# Altium schematic sheet CODEC_INTERFACE.SchDoc
size A4; SheetNumber: 20; SheetTotal: 20
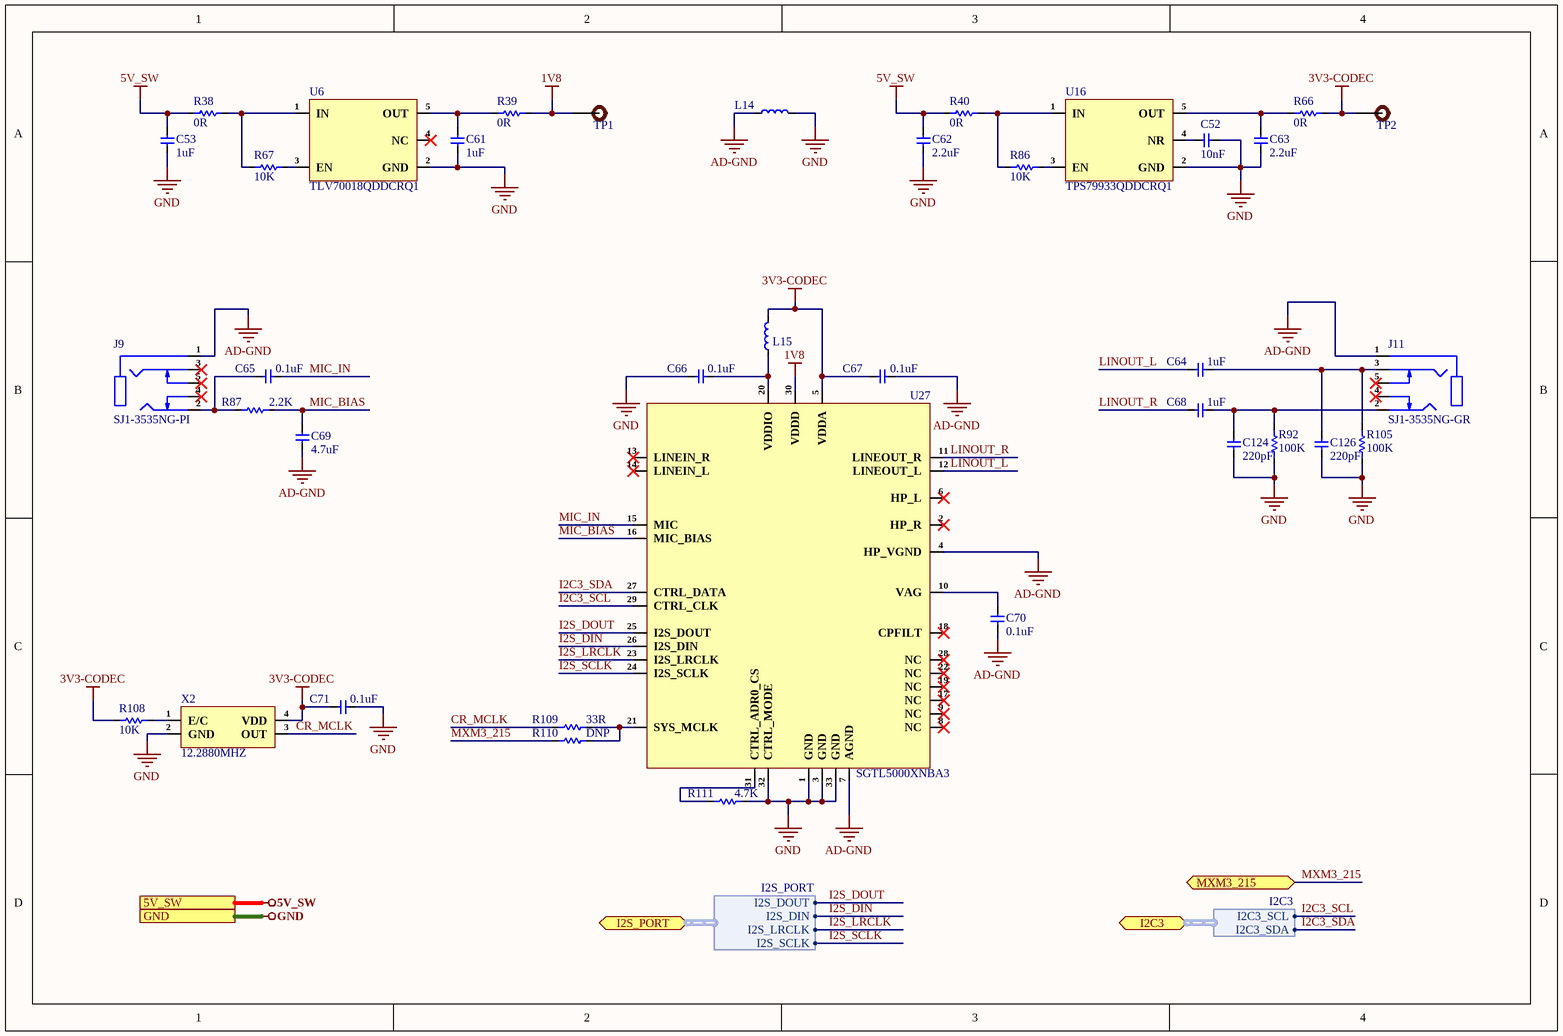
[diagram p0: CODEC_INTERFACE.SchDoc]

## Parts
C52  10nF  [Cap-0402]
C53  1uF  [Cap-0603]
C61  1uF  [Cap-0603]
C62  2.2uF  [Cap-0603]
C63  2.2uF  [Cap-0603]
C64  1uF  [Cap-0603]
C65  0.1uF  [Cap-0402]
C66  0.1uF  [Cap-0402]
C67  0.1uF  [Cap-0402]
C68  1uF  [Cap-0603]
C69  4.7uF  [Cap-0603]
C70  0.1uF  [Cap-0402]
C71  0.1uF  [Cap-0402]
C124  220pF  [Cap-0402]
C126  220pF  [Cap-0402]
J9  SJ1-3535NG-PI  [SJ1-3535NG-PI]
J11  SJ1-3535NG-GR  [SJ1-3535NG-GR]
L14  BLM21PG220SN1D  [Ind-0805]  (value not drawn)
L15  BLM21PG220SN1D  [Ind-0805]  (value not drawn)
R38  0R  [Res-1206]
R39  0R  [Res-1206]
R40  0R  [Res-1206]
R66  0R  [Res-1206]
R67  10K  [Res-0603]
R86  10K  [Res-0603]
R87  2.2K  [Res-0603]
R92  100K  [Res-0402]
R105  100K  [Res-0402]
R108  10K  [Res-0603]
R109  33R  [Res-0402]
R110  DNP  [Res-0402]
R111  4.7K  [Res-0603]
TP1  DNP  [Test-point]  (value not drawn)
TP2  DNP  [Test-point]  (value not drawn)
U6  TLV70018QDDCRQ1  [SOT-23-5]
U16  TPS79933QDDCRQ1  [SOT-23-5]
U27  SGTL5000XNBA3  [32-QFN]
X2  12.2880MHZ  [AU-12.288MBE-T]

## Ports
5V_SW (see Top_Sheet[4B], APALIS_POWER_SUPPLY[1D], FUTURE_USE_CONNECTOR[1D], HDMI_INTERFACE[1D], LTE_MODULE[1D], USB3.0_INTERFACE[1D]), GND (see Top_Sheet[3B], 03-CAN2_SPI_CAN_CONTROLLER[1D], APALIS_POWER_SUPPLY[1D], CAN2_SPI_CAN_CONTROLLER[1D], CONNECTORS[1D], DC_DC_CONVERTER[1D], DIGITAL_I-O_O-P[1D], ETHERNET_INTERFACE[1D], FUTURE_USE_CONNECTOR[1D], GPIO_NC_INTERFACE[4B], HDMI_INTERFACE[1D], I2C_INTERFACE[1B], INPUT_SUPPLY_PROTECTION[1D], LTE_MODULE[1D], MECHANICAL_FOR_PCB[1D], MICRO_SD_CARD_INTERFACE[1D], Reset_and_SDIO[1D], UART_INTERFACE[1D], USB3.0_INTERFACE[1D]), I2C3 (bidir, harness I2C3, see Top_Sheet[4B], CONNECTORS[2C], I2C_INTERFACE[4B]), I2S_PORT (bidir, harness I2S_PORT, see Top_Sheet[3C], GPIO_NC_INTERFACE[1A]), MXM3_215 (bidir, see Top_Sheet[3B], GPIO_NC_INTERFACE[2A])

## Harnesses
I2C3: I2C3_SCL, I2C3_SDA
I2S_PORT: I2S_DOUT, I2S_DIN, I2S_LRCLK, I2S_SCLK

## Nets
1V8: R39.2 TP1.1 U27.30(VDDD)
3V3-CODEC: C67.1 C71.2 L15.2 R66.2 R108.1 TP2.1 U27.5(VDDA) X2.4(VDD)
5V_SW: C53.2 C62.2 R38.1 R40.1 ; port 5V_SW
AD-GND: C67.2 C69.1 C70.2 J9.1 J11.1 L14.1 U27.4(HP_VGND) U27.7(AGND)
GND: C52.2 C53.1 C61.1 C62.1 C63.1 C66.2 C71.1 C124.1 C126.1 L14.2 R92.1 R105.1 R111.2 U6.2(GND) U16.2(GND) U27.1(GND) U27.3(GND) U27.32(CTRL_MODE) U27.33(GND) X2.2(GND) ; port GND
CR_MCLK: R109.1 X2.3(OUT)
I2C3_SCL: U27.29(CTRL_CLK) ; port I2C3.I2C3_SCL
I2C3_SDA: U27.27(CTRL_DATA) ; port I2C3.I2C3_SDA
I2S_DIN: U27.26(I2S_DIN) ; port I2S_PORT.I2S_DIN
I2S_DOUT: U27.25(I2S_DOUT) ; port I2S_PORT.I2S_DOUT
I2S_LRCLK: U27.23(I2S_LRCLK) ; port I2S_PORT.I2S_LRCLK
I2S_SCLK: U27.24(I2S_SCLK) ; port I2S_PORT.I2S_SCLK
LINOUT_L: C64.2 U27.12(LINEOUT_L)
LINOUT_R: C68.2 U27.11(LINEOUT_R)
MIC_BIAS: C69.2 R87.2 U27.16(MIC_BIAS)
MIC_IN: C65.2 U27.15(MIC)
MXM3_215: R110.1 ; port MXM3_215
NetC52_1: C52.1 U16.4(NR)
NetC61_2: C61.2 R39.1 U6.5(OUT)
NetC63_2: C63.2 R66.1 U16.5(OUT)
NetC64_1: C64.1 C126.2 J11.3 R105.2
NetC65_1: C65.1 J9.2 R87.1
NetC66_1: C66.1 L15.1 U27.20(VDDIO)
NetC68_1: C68.1 C124.2 J11.2 R92.2
NetC70_1: C70.1 U27.10(VAG)
NetR38_2: R38.2 R67.1 U6.1(IN)
NetR40_2: R40.2 R86.1 U16.1(IN)
NetR67_2: R67.2 U6.3(EN)
NetR86_2: R86.2 U16.3(EN)
NetR108_2: R108.2 X2.1(E/C)
NetR109_2: R109.2 R110.2 U27.21(SYS_MCLK)
NetR111_1: R111.1 U27.31(CTRL_ADR0_CS)

Not connected (* = marked no-connect by the designer): J9 3* 4* 5*; J11 4* 5*; U6 4(NC)*; U27 2(HP_R)* 6(HP_L)* 8(NC)* 9(NC)* 13(LINEIN_R)* 14(LINEIN_L)* 17(NC)* 18(CPFILT)* 19(NC)* 22(NC)* 28(NC)*

## Library data of the parts
C52 = C0402C103K5RAC7411: CAP CER 10000PF 50V X7R 0402; Manufacturer: KEMET; Dielectric Material: Ceramic; Tolerance: 10%; Item Type: Capacitor; Supplier: Mouser; Supplier Part Number: 80-C0402C103K5R7411; Manufacturer Part Number: C0402C103K5RAC7411; RoHS: Yes; Category: Ceramic Capacitors; Stock: 440672; Pricing: 1=0.1, 10=0.017, 50=0.017, 100=0.009, 1000=0.005, 10000=0.004 (USD); Mounting Technology: Surface Mount; Case/Package: 0402; Min Operating Temperature: -55°C; Max Operating Temperature: 125°C; Value: 10nF; Dielectric: X7R; Voltage Rating (DC): 50V; Construction: Flat; Length: 1mm; Height: 0.5mm; Depth: 0.5mm; Radiation Hardening: No; RoHS Compliant: Yes; ComponentLink1URL: http://capacitoredge.kemet.com/capedge2/DataSheet?pn=C0402C103K5RAC7411&src-supplier=Avnet; ComponentLink1Description: http://capacitoredge.kemet.com/capedge2/DataSheet?pn=C0402C103K5RAC7411&src-supplier=Avnet
C53 C61 C64 C68 = CGA3E1X7R1E105K080AC: CAP CER 1UF 25V X7R 0603; Manufacturer: TDK; Material: 4241ConductorMaterial; Tolerance: 10%; Supplier: Rs; Supplier Part Number: 7882925P; Manufacturer Part Number: CGA3E1X7R1E105K080AC; RoHS: Yes; Category: Ceramic Capacitors; Stock: 80700; Pricing: 800=0.027, 2000=0.026 (GBP); Mounting Technology: Surface Mount; Case/Package: 0603; Case Code (Metric): 1608; Case Code (Imperial): 0603; Weight: 7.1E-05oz; Min Operating Temperature: -55°C; Max Operating Temperature: 125°C; Value: 1uF; Packaging: Tape and Reel; Dielectric: X7R; Voltage Rating: 25V; Package Quantity: 1; Voltage Rating (DC): 25V; Termination: SMD/SMT; Voltage: 25V; Series: CGA; Length: 1.6mm; Width: 0.031inch; Height: 0.8mm; Depth: 0.8mm; Thickness: 0.035inch; Ratings: AEC-Q200; Lead Free: Lead Free; Reach SVHC Compliant: No; RoHS Compliant: Yes; ComponentLink1URL: https://datasheet.ciiva.com/24216/cga3e1x7r1e105k080ac-265757-24216362.pdf?src-supplier=Mouser; ComponentLink1Description: https://datasheet.ciiva.com/24216/cga3e1x7r1e105k080ac-265757-24216362.pdf?src-supplier=Mouser; ComponentLink2URL: https://datasheet.ciiva.com/23803/1936565-23803078.pdf?src-supplier=Newark; ComponentLink2Description: https://datasheet.ciiva.com/23803/1936565-23803078.pdf?src-supplier=Newark; ComponentLink3URL: https://datasheet.ciiva.com/46385/1735392-46385705.pdf?src-supplier=Element14; ComponentLink3Description: https://datasheet.ciiva.com/46385/1735392-46385705.pdf?src-supplier=Element14; ComponentLink4URL: https://datasheet.ciiva.com/48573/2288cga3e1x7r1e105k080ac-48573708.pdf?src-supplier=Onlinecomponents.com; ComponentLink4Description: https://datasheet.ciiva.com/48573/2288cga3e1x7r1e105k080ac-48573708.pdf?src-supplier=Onlinecomponents.com; ComponentLink5URL: https://datasheet.ciiva.com/16428/mlccspec-automotive-general-midvoltage-en-16428542.pdf?src-supplier=Future+Electronics; ComponentLink5Description: https://datasheet.ciiva.com/16428/mlccspec-automotive-general-midvoltage-en-16428542.pdf?src-supplier=Future+Electronics
C62 C63 = C1608X7R1A225K080AC: CAP CER 2.2UF 10V X7R 0603; Manufacturer: TDK; Dielectric Material: Ceramic; Tolerance: 10%; Item type: Capacitor; Supplier: Rs; Supplier Part Number: 9040237; Manufacturer Part Number: C1608X7R1A225K080AC; RoHS: Yes; Category: Ceramic Capacitors; Stock: 4700; Pricing: 50=0.061, 250=0.052, 500=0.043, 1000=0.04, 2000=0.036 (GBP); Mounting Technology: Surface Mount; Case/Package: 0603; Case Code (Metric): 1608; Case Code (Imperial): 0603; Weight: 7.1E-05oz; Min Operating Temperature: -55°C; Max Operating Temperature: 125°C; Packaging: Tape and Reel; Value: 2.2uF; Dielectric: X7R; Construction: Flat; Voltage Rating: 10V; Voltage Rating (DC): 10V; Series: C; Package Quantity: 4000; Termination: SMD/SMT; Length: 1.6mm; Width: 0.8mm; Height: 0.8mm; Depth: 0.8mm; Lead Free: Lead Free; Reach SVHC Compliant: No; RoHS Compliant: Yes; ComponentLink1URL: https://datasheet.ciiva.com/24216/c1608x7r1a225k080ac-264808-24216485.pdf?src-supplier=Mouser; ComponentLink1Description: https://datasheet.ciiva.com/24216/c1608x7r1a225k080ac-264808-24216485.pdf?src-supplier=Mouser; ComponentLink2URL: https://datasheet.ciiva.com/22718/1796654-22718012.pdf?src-supplier=Element14; ComponentLink2Description: https://datasheet.ciiva.com/22718/1796654-22718012.pdf?src-supplier=Element14; ComponentLink3URL: https://datasheet.ciiva.com/6290/tdkmlcccaprange-6290821.pdf?src-supplier=Digi-Key; ComponentLink3Description: https://datasheet.ciiva.com/6290/tdkmlcccaprange-6290821.pdf?src-supplier=Digi-Key; ComponentLink4URL: https://datasheet.ciiva.com/6290/tdkmlcccaprange-6290824.pdf?src-supplier=Digi-Key; ComponentLink4Description: https://datasheet.ciiva.com/6290/tdkmlcccaprange-6290824.pdf?src-supplier=Digi-Key; ComponentLink5URL: https://datasheet.ciiva.com/23802/1796654-23802775.pdf?src-supplier=Newark; ComponentLink5Description: https://datasheet.ciiva.com/23802/1796654-23802775.pdf?src-supplier=Newark; ComponentLink6URL: https://datasheet.ciiva.com/28451/1796654-28451240.pdf?src-supplier=Element14; ComponentLink6Description: https://datasheet.ciiva.com/28451/1796654-28451240.pdf?src-supplier=Element14; ComponentLink7URL: https://datasheet.ciiva.com/22725/1913358-22725529.pdf?src-supplier=Element14; ComponentLink7Description: https://datasheet.ciiva.com/22725/1913358-22725529.pdf?src-supplier=Element14
C65-C67 C70 C71 = C0402C104K4REC7867: Cap Cer 0402 0.1UF 16V X7R 10%; Manufacturer: KEMET; Item Type: Capacitor; Supplier: Digi-Key; Supplier Part Number: 399-C0402C104K4REC7867CT-ND; Manufacturer Part Number: C0402C104K4REC7867; RoHS: No; Category: Ceramic Capacitors; Stock: 10918; Pricing: 1=0.1, 10=0.072, 50=0.0408, 100=0.0338, 500=0.02372, 1000=0.01963, 2500=0.01827, 5000=0.01672 (USD)
C69 = C1608X5R1A475K080AE: CAP CER 4.7UF 10V X5R 0603; Manufacturer: TDK; Item Type: Capacitor; Supplier: Arrow Electronics; Supplier Part Number: C1608X5R1A475K080AE; Manufacturer Part Number: C1608X5R1A475K080AE; RoHS: Yes; Category: Ceramic Capacitors; Stock: 1894; Pricing: 1=0.1954, 10=0.1074, 25=0.1063, 50=0.1053, 100=0.0737, 250=0.073, 500=0.0723, 1000=0.0631 (USD); ComponentLink1URL: https://product.tdk.com/info/en/catalog/datasheets/mlcc_commercial_soft_en.pdf?src-supplier=Digi-Key; ComponentLink1Description: https://product.tdk.com/info/en/catalog/datasheets/mlcc_commercial_soft_en.pdf?src-supplier=Digi-Key; ComponentLink2URL: https://product.tdk.com/info/en/catalog/datasheets/mlcc_commercial_soft_en.pdf?ref_disty=digikey&src-supplier=Digi-Key; ComponentLink2Description: https://product.tdk.com/info/en/catalog/datasheets/mlcc_commercial_soft_en.pdf?ref_disty=digikey&src-supplier=Digi-Key; ComponentLink3URL: https://product.tdk.com/info/en/catalog/spec/mlccspec_commercial_soft_en.pdf?src-supplier=Digi-Key; ComponentLink3Description: https://product.tdk.com/info/en/catalog/spec/mlccspec_commercial_soft_en.pdf?src-supplier=Digi-Key; ComponentLink4URL: https://datasheet.octopart.com/C1608X5R1A475K080AE-TDK-datasheet-60278151.pdf?src-supplier=Future+Electronics; ComponentLink4Description: https://datasheet.octopart.com/C1608X5R1A475K080AE-TDK-datasheet-60278151.pdf?src-supplier=Future+Electronics; ComponentLink5URL: https://datasheet.octopart.com/C1608X5R1A475K080AE-TDK-datasheet-159617022.pdf?src-supplier=TME; ComponentLink5Description: https://datasheet.octopart.com/C1608X5R1A475K080AE-TDK-datasheet-159617022.pdf?src-supplier=TME
C124 C126 = C0402C221K3RACAUTO: Cap Cer 220PF 25V X7R 0402; Manufacturer: KEMET; Supplier: Mouser; Supplier Part Number: 80-C0402C221K3RAUTO; Manufacturer Part Number: C0402C221K3RACAUTO; RoHS: Yes; Category: Ceramic Capacitors; Stock: 7535; Pricing: 1=0.36, 10=0.251, 50=0.251, 100=0.15, 1000=0.095, 10000=0.077 (USD); RoHS Compliant: Yes
J9 = SJ1-3535NG-PI: CONN JACK STEREO 3.5MM R/A Pink; Manufacturer: CUI; Gender: Female; Shielding: Unshielded; Current Rating: 1A; Number of Conductors: 3; Number of Ports: 1; Supplier: Mouser; Supplier Part Number: 490-SJ1-3535NG-PI; Manufacturer Part Number: SJ1-3535NG-PI; RoHS: No; Category: Uncategorized; Mounting Technology: Through Hole; Contact Plating: Tin; Color: Pink; Body Color: Pink; Packaging: Bulk; Termination: Solder; Orientation: Horizontal; Connector Type: Jack; Series: SJ1; Lead Free: Lead Free; RoHS Compliant: No; ComponentLink1URL: https://www.cui.com/product/resource/digikeypdf/sj1-353xng.pdf?src-supplier=Digi-Key; ComponentLink1Description: https://www.cui.com/product/resource/digikeypdf/sj1-353xng.pdf?src-supplier=Digi-Key
J11 = SJ1-3535NG-GR: CONN JACK STEREO 3.5MM R/A Green; Manufacturer: CUI; Gender: Female; Shielding: Unshielded; Current Rating: 1A; Number of Conductors: 3; Number of Ports: 1; Supplier: Mouser; Supplier Part Number: 490-SJ1-3535NG-GR; Manufacturer Part Number: SJ1-3535NG-GR; RoHS: No; Category: Uncategorized; Mounting Technology: Through Hole; Contact Plating: Tin; Color: Green; Body Color: Green; Packaging: Bulk; Termination: Solder; Orientation: Horizontal; Connector Type: Jack; Series: SJ1; Lead Free: Lead Free; RoHS Compliant: No; ComponentLink1URL: https://www.cui.com/product/resource/digikeypdf/sj1-353xng.pdf?src-supplier=Digi-Key; ComponentLink1Description: https://www.cui.com/product/resource/digikeypdf/sj1-353xng.pdf?src-supplier=Digi-Key
L14 L15 = BLM21PG220SN1D: FERRITE BEAD 22 OHM 0805 1LN; Manufacturer: Murata; Supplier: Rs; Supplier Part Number: 7241539P; Manufacturer Part Number: BLM21PG220SN1D; RoHS: Yes; Category: Ferrite Beads and Chips; Stock: 10325; Pricing: 500=0.043, 1000=0.038, 2500=0.033, 5000=0.03 (GBP); ComponentLink1URL: https://datasheet.ciiva.com/14122/anblm21p-data-e-14122211.pdf?src-supplier=Distrelec; ComponentLink1Description: https://datasheet.ciiva.com/14122/anblm21p-data-e-14122211.pdf?src-supplier=Distrelec; ComponentLink2URL: https://datasheet.ciiva.com/11799/0900766b81275e31-11799177.pdf?src-supplier=Rs; ComponentLink2Description: https://datasheet.ciiva.com/11799/0900766b81275e31-11799177.pdf?src-supplier=Rs; ComponentLink3URL: https://datasheet.ciiva.com/29700/1845312-29700540.pdf?src-supplier=Jameco; ComponentLink3Description: https://datasheet.ciiva.com/29700/1845312-29700540.pdf?src-supplier=Jameco; ComponentLink4URL: https://datasheet.ciiva.com/16291/l0110s0100blm21p-16291622.pdf?src-supplier=Future+Electronics; ComponentLink4Description: https://datasheet.ciiva.com/16291/l0110s0100blm21p-16291622.pdf?src-supplier=Future+Electronics; ComponentLink5URL: https://datasheet.ciiva.com/8021/5160-8021589.pdf?src-supplier=Element14; ComponentLink5Description: https://datasheet.ciiva.com/8021/5160-8021589.pdf?src-supplier=Element14; ComponentLink6URL: https://datasheet.ciiva.com/8021/5160-8021591.pdf?src-supplier=Element14; ComponentLink6Description: https://datasheet.ciiva.com/8021/5160-8021591.pdf?src-supplier=Element14; ComponentLink7URL: https://datasheet.ciiva.com/6211/l0110s0100blm21p-6211741.pdf?src-supplier=Digi-Key; ComponentLink7Description: https://datasheet.ciiva.com/6211/l0110s0100blm21p-6211741.pdf?src-supplier=Digi-Key; ComponentLink8URL: https://datasheet.ciiva.com/3081/l0110s0100blm21p-3081653.pdf?src-supplier=Avnet; ComponentLink8Description: https://datasheet.ciiva.com/3081/l0110s0100blm21p-3081653.pdf?src-supplier=Avnet; ComponentLink9URL: https://datasheet.ciiva.com/41449/001171738-da-01-en-chip-drossel0805-22r0-6000ma-2-0x1-25mm-41449366.pdf?src-supplier=Conrad; ComponentLink9Description: https://datasheet.ciiva.com/41449/001171738-da-01-en-chip-drossel0805-22r0-6000ma-2-0x1-25mm-41449366.pdf?src-supplier=Conrad; LCSC Part Number: C88993; Item Type: Ferrite Bead
R38-R40 R66 = RC1206JR-070RL: RES 0 OHM JUMPER 1/4W 1206; Manufacturer: Yageo; Value: 0mR; Tolerance: 5%; Power Rating: 250mW; Voltage Rating: 200V; Temperature Coefficient: 200ppm/°C; Supplier: Future Electronics; Supplier Part Number: 1070203; Manufacturer Part Number: RC1206JR-070RL; RoHS: Yes; Category: Chip SMD Resistors; Stock: 615000; Pricing: 5000=0.0047, 25000=0.0045, 100000=0.0042, 250000=0.0041, 625000=0.0038 (USD); Case/Package: 1206; Contact Plating: Tin,Matte; Case Code (Metric): 3216; Case Code (Imperial): 1206; Min Operating Temperature: -55°C; Max Operating Temperature: 155°C; Resistor Type: Thick Film,Carbon Film; Packaging: Tape and Reel; Package Quantity: 1; Number of Terminations: 2; Termination: SMD/SMT; Max Power Dissipation: 250mW; Series: RC; Resistance Tolerance: 5%; Technology: THICK FILM; Features: Moisture Resistant; Voltage Rating (AC): 200V; Length: 0.122inch; Width: 0.063inch; Height: 0.026inch; Depth: 1.6mm; Lead Free: Lead Free; RoHS Compliant: Yes; Reach SVHC Compliant: Unknown; ComponentLink1URL: https://datasheet.ciiva.com/11808/0900766b80c6630a-11808156.pdf?src-supplier=Rs; ComponentLink1Description: https://datasheet.ciiva.com/11808/0900766b80c6630a-11808156.pdf?src-supplier=Rs; ComponentLink2URL: https://datasheet.ciiva.com/29181/402222-da-01-en-smd-widerstand-0-ohm-1206-29181568.pdf?src-supplier=Conrad; ComponentLink2Description: https://datasheet.ciiva.com/29181/402222-da-01-en-smd-widerstand-0-ohm-1206-29181568.pdf?src-supplier=Conrad; ComponentLink3URL: https://datasheet.ciiva.com/7983/444357-7983807.pdf?src-supplier=Element14; ComponentLink3Description: https://datasheet.ciiva.com/7983/444357-7983807.pdf?src-supplier=Element14; ComponentLink4URL: https://datasheet.ciiva.com/22747/1692832-22747541.pdf?src-supplier=Element14; ComponentLink4Description: https://datasheet.ciiva.com/22747/1692832-22747541.pdf?src-supplier=Element14; ComponentLink5URL: https://datasheet.ciiva.com/46445/444357-46445719.pdf?src-supplier=Element14; ComponentLink5Description: https://datasheet.ciiva.com/46445/444357-46445719.pdf?src-supplier=Element14; ComponentLink6URL: https://datasheet.ciiva.com/2458/pyu-rc1206-51-rohs-l-4-2458669.pdf?src-supplier=Digi-Key; ComponentLink6Description: https://datasheet.ciiva.com/2458/pyu-rc1206-51-rohs-l-4-2458669.pdf?src-supplier=Digi-Key; ComponentLink7URL: https://datasheet.ciiva.com/2458/pyu-rc1206-51-rohs-l-4-2458670.pdf?src-supplier=Digi-Key; ComponentLink7Description: https://datasheet.ciiva.com/2458/pyu-rc1206-51-rohs-l-4-2458670.pdf?src-supplier=Digi-Key; ComponentLink8URL: https://datasheet.ciiva.com/2458/pyu-rc1206-51-rohs-l-4-2458668.pdf?src-supplier=Digi-Key; ComponentLink8Description: https://datasheet.ciiva.com/2458/pyu-rc1206-51-rohs-l-4-2458668.pdf?src-supplier=Digi-Key; ComponentLink9URL: https://datasheet.ciiva.com/7857/1692832-7857422.pdf?src-supplier=Element14; ComponentLink9Description: https://datasheet.ciiva.com/7857/1692832-7857422.pdf?src-supplier=Element14; ComponentLink10URL: https://datasheet.ciiva.com/7857/1692832-7857421.pdf?src-supplier=Element14; ComponentLink10Description: https://datasheet.ciiva.com/7857/1692832-7857421.pdf?src-supplier=Element14; ComponentLink11URL: https://datasheet.ciiva.com/17035/pyu-rc1206-51-rohs-l-4-17035512.pdf?src-supplier=Future+Electronics; ComponentLink11Description: https://datasheet.ciiva.com/17035/pyu-rc1206-51-rohs-l-4-17035512.pdf?src-supplier=Future+Electronics
R67 R86 R108 = RCA060310K0FKEAHP: RES SMD 10K OHM 1% 1/10W 0603; Manufacturer: Vishay Dale; Value: 10kR; Max Power Dissipation: 250mW; Temperature Coefficient: 100ppm/°C; Supplier: Future Electronics; Supplier Part Number: 4171415; Manufacturer Part Number: RCA060310K0FKEAHP; RoHS: Yes; Category: Chip SMD Resistors; Stock: 10000; Pricing: 5000=0.0413, 10000=0.0403, 15000=0.0397, 25000=0.0389, 50000=0.0374 (USD); Case/Package: 0603; Case Code (Imperial): 0603; Case Code (Metric): 1608; Min Operating Temperature: -55°C; Max Operating Temperature: 155°C; Features: Automotive AEC-Q200,Anti-Sulfur; Packaging: Cut Tape; Tolerance: 1%; Number of Terminations: 2; Series: RCA-HP; Ratings: AEC-Q200; RoHS Compliant: Yes; ComponentLink1URL: http://www.vishay.com/docs/20067/rcahp.pdf?src-supplier=Digi-Key; ComponentLink1Description: http://www.vishay.com/docs/20067/rcahp.pdf?src-supplier=Digi-Key
R87 = ERA-3AED222V: RES SMD 2.2K OHM 0.5% 1/10W 0603; Manufacturer: Panasonic; Value: 2.2kR; Power Rating: 100mW; Voltage Rating: 150V; Temperature Coefficient: 25ppm/°C; Supplier: Digi-Key; Supplier Part Number: P123753DKR-ND; Manufacturer Part Number: ERA-3AED222V; RoHS: Yes; Category: Chip SMD Resistors; Pricing: 1=0.27, 10=0.23, 25=0.1672, 50=0.1212, 100=0.0899, 250=0.069, 500=0.05436, 1000=0.03763 (USD); Mounting Technology: Surface Mount; Case/Package: 0603; Case Code (Imperial): 0603; Case Code (Metric): 1608; Contact Plating: Tin; Min Operating Temperature: -55°C; Max Operating Temperature: 155°C; Tolerance: 0.5%; Package Quantity: 5000; Packaging: Tape and Reel; Series: ERA-3A; Features: Automotive AEC-Q200; Max Power Dissipation: 100mW; Number of Terminations: 2; Length: 1.6mm; Width: 0.8mm; Height: 0.45mm; Ratings: AEC-Q200; Lead Free: Lead Free; RoHS Compliant: Yes; ComponentLink1URL: https://datasheet.ciiva.com/24024/aoa0000ce26-197354-24024457.pdf?src-supplier=Mouser; ComponentLink1Description: https://datasheet.ciiva.com/24024/aoa0000ce26-197354-24024457.pdf?src-supplier=Mouser
R92 R105 = RC0402JR-07100KL: RES 100K OHM 5% 1/16W 0402; Manufacturer: Yageo; Voltage Rating: 50V; Value: 100kR; Power Rating: 62.5mW; Temperature Coefficient: 100ppm/°C; Max Power Dissipation: 63mW; Supplier: Future Electronics; Supplier Part Number: 4246625; Manufacturer Part Number: RC0402JR-07100KL; RoHS: Yes; Category: Chip SMD Resistors; Stock: 7540000; Pricing: 10000=0.0013, 100000=0.0008, 200000=0.0013, 400000=0.0008, 750000=0.0012, 1250000=0.0007, 2500000=0.0012, 4000000=0.0007, 10000000=0.0011 (USD); Case/Package: 0402; Case Code (Metric): 1005; Case Code (Imperial): 0402; Min Operating Temperature: -55°C; Max Operating Temperature: 155°C; Packaging: Tape and Reel; Termination: SMD/SMT; Tolerance: 5%; Series: RC; Resistor Type: Thick Film; Number of Terminations: 2; Features: Moisture Resistant; Resistance Tolerance: 5%; Construction: Rectangular; Length: 1mm; Depth: 0.5mm; Lead Free: Lead Free; Reach SVHC Compliant: Unknown; RoHS Compliant: Yes; Military Standard: Not; ComponentLink1URL: https://datasheet.ciiva.com/2491/pyu-r-int-thick-7-2491208.pdf?src-supplier=Digi-Key; ComponentLink1Description: https://datasheet.ciiva.com/2491/pyu-r-int-thick-7-2491208.pdf?src-supplier=Digi-Key; ComponentLink2URL: https://datasheet.ciiva.com/46394/1018594-46394941.pdf?src-supplier=Element14; ComponentLink2Description: https://datasheet.ciiva.com/46394/1018594-46394941.pdf?src-supplier=Element14; ComponentLink3URL: https://datasheet.ciiva.com/2491/pyu-r-int-thick-7-2491209.pdf?src-supplier=Digi-Key; ComponentLink3Description: https://datasheet.ciiva.com/2491/pyu-r-int-thick-7-2491209.pdf?src-supplier=Digi-Key; ComponentLink4URL: https://datasheet.ciiva.com/2491/pyu-r-int-thick-7-2491207.pdf?src-supplier=Digi-Key; ComponentLink4Description: https://datasheet.ciiva.com/2491/pyu-r-int-thick-7-2491207.pdf?src-supplier=Digi-Key; ComponentLink5URL: https://datasheet.ciiva.com/12668/pyu-rc0402-51-rohs-l-6-r-12668218.pdf?src-supplier=Mouser; ComponentLink5Description: https://datasheet.ciiva.com/12668/pyu-rc0402-51-rohs-l-6-r-12668218.pdf?src-supplier=Mouser
R109 R110 = AF0402FR-0733RL: RES SMD 33 OHM 1% 1/16W 0402; Manufacturer: Yageo; Voltage Rating: 50V; Supplier: Future Electronics; Supplier Part Number: 2101591; Manufacturer Part Number: AF0402FR-0733RL; RoHS: Yes; Category: Chip SMD Resistors; Stock: 20000; Pricing: 10000=0.0024, 50000=0.0022, 200000=0.0021, 500000=0.002, 1250000=0.0019 (USD); ComponentLink1URL: http://www.yageo.com/documents/recent/PYu-AF_51_RoHS_L_5.pdf?src-supplier=Digi-Key; ComponentLink1Description: http://www.yageo.com/documents/recent/PYu-AF_51_RoHS_L_5.pdf?src-supplier=Digi-Key; ComponentLink2URL: https://datasheet.octopart.com/AF0402FR-0733RL-Yageo-datasheet-164730775.pdf?src-supplier=Future+Electronics; ComponentLink2Description: https://datasheet.octopart.com/AF0402FR-0733RL-Yageo-datasheet-164730775.pdf?src-supplier=Future+Electronics
R111 = ERA-3AEB472V: RES SMD 4.7K OHM 0.1% 1/10W 0603; Manufacturer: Panasonic; Supplier: Rs; Supplier Part Number: 566888P; Manufacturer Part Number: ERA-3AEB472V; RoHS: Yes; Category: Chip SMD Resistors; Stock: 5210; Pricing: 50=0.242, 100=0.198, 250=0.156, 500=0.114 (GBP); ComponentLink1URL: https://datasheet.ciiva.com/11808/0900766b80fe20f7-11808039.pdf?src-supplier=Rs; ComponentLink1Description: https://datasheet.ciiva.com/11808/0900766b80fe20f7-11808039.pdf?src-supplier=Rs; ComponentLink2URL: https://datasheet.ciiva.com/29183/451124-da-01-en-widerstand-0603-era-29183789.pdf?src-supplier=Conrad; ComponentLink2Description: https://datasheet.ciiva.com/29183/451124-da-01-en-widerstand-0603-era-29183789.pdf?src-supplier=Conrad; ComponentLink3URL: https://datasheet.ciiva.com/22743/485442-22743061.pdf?src-supplier=Element14; ComponentLink3Description: https://datasheet.ciiva.com/22743/485442-22743061.pdf?src-supplier=Element14; ComponentLink4URL: https://datasheet.ciiva.com/46422/485442-46422693.pdf?src-supplier=Element14; ComponentLink4Description: https://datasheet.ciiva.com/46422/485442-46422693.pdf?src-supplier=Element14; ComponentLink5URL: https://datasheet.ciiva.com/30078/54aoa0000ce26-30078815.pdf?src-supplier=Onlinecomponents.com; ComponentLink5Description: https://datasheet.ciiva.com/30078/54aoa0000ce26-30078815.pdf?src-supplier=Onlinecomponents.com; ComponentLink6URL: https://datasheet.ciiva.com/16772/70068849-16772572.pdf?src-supplier=Allied+Electronics; ComponentLink6Description: https://datasheet.ciiva.com/16772/70068849-16772572.pdf?src-supplier=Allied+Electronics; ComponentLink7URL: https://datasheet.ciiva.com/48425/era-eng-tds-48425470.pdf?src-supplier=Distrelec; ComponentLink7Description: https://datasheet.ciiva.com/48425/era-eng-tds-48425470.pdf?src-supplier=Distrelec; ComponentLink8URL: https://datasheet.ciiva.com/22781/485442-22781497.pdf?src-supplier=Farnell; ComponentLink8Description: https://datasheet.ciiva.com/22781/485442-22781497.pdf?src-supplier=Farnell; ComponentLink9URL: https://datasheet.ciiva.com/43455/485442-43455227.pdf?src-supplier=Farnell; ComponentLink9Description: https://datasheet.ciiva.com/43455/485442-43455227.pdf?src-supplier=Farnell; ComponentLink10URL: https://datasheet.ciiva.com/9117/aoa0000ce26-9117707.pdf?src-supplier=Avnet; ComponentLink10Description: https://datasheet.ciiva.com/9117/aoa0000ce26-9117707.pdf?src-supplier=Avnet; ComponentLink11URL: https://datasheet.ciiva.com/9116/aoa0000ce26-9116681.pdf?src-supplier=Avnet; ComponentLink11Description: https://datasheet.ciiva.com/9116/aoa0000ce26-9116681.pdf?src-supplier=Avnet
TP1 TP2 = TEST POINT: Test Point ON; Item Type: TEST POINT
U6 = TLV70018QDDCRQ1: IC REG LINEAR 1.8V 300MA SOT23-5; Manufacturer: Texas Instruments; Max Power Dissipation: 500mW; Number of Outputs: 1; Max Output current: 200mA; Max Supply Voltage: 5.5V; Min Input Voltage: 2V; Min Current Limit: 320mA; Polarity: Positive; Accuracy: 2%; Quiescent Current: 30uA; Output Type: Fixed; Max Supply Current: 270uA; Power Supply Rejection Ratio (PSRR): 68dB; Supplier: Mouser; Supplier Part Number: 595-TLV70018QDDCRQ1; Manufacturer Part Number: TLV70018QDDCRQ1; RoHS: Yes; Category: Voltage Regulators - Linear; Stock: 9892; Pricing: 1=0.83, 10=0.689, 50=0.689, 100=0.523, 1000=0.356, 10000=0.294 (USD); Case/Package: SOT-23-5; Pins: 5; Min Operating Temperature: -40°C; Max Operating Temperature: 125°C; Packaging: Tape and Reel; Package Quantity: 3000; Output Voltage: 1.8V; Output Current: 300mA; Number of Regulators: 1; Max Output Voltage: 1.8V; Min Output Voltage: 1.8V; Series: Automotive, AEC-Q100; Output Configuration: Positive; Lead Free: Lead Free; RoHS Compliant: Yes; ComponentLink1URL: https://datasheet.ciiva.com/29568/tlv7001x-q1-29568384.pdf?src-supplier=Digi-Key; ComponentLink1Description: https://datasheet.ciiva.com/29568/tlv7001x-q1-29568384.pdf?src-supplier=Digi-Key
U16 = TPS79933QDDCRQ1: IC REG LINEAR 3.3V 200MA SOT23-5; Manufacturer: Texas Instruments; Supplier: Mouser; Supplier Part Number: 595-TPS79933QDDCRQ1; Manufacturer Part Number: TPS79933QDDCRQ1; RoHS: Yes; Category: Voltage Regulators - Linear; Stock: 7856; Pricing: 1=1.2, 10=1.02, 50=1.02, 100=0.78, 1000=0.544, 10000=0.463 (USD); ComponentLink1URL: https://datasheet.ciiva.com/2044/tps79933-q1-2044901.pdf?src-supplier=Digi-Key; ComponentLink1Description: https://datasheet.ciiva.com/2044/tps79933-q1-2044901.pdf?src-supplier=Digi-Key; ComponentLink2URL: https://datasheet.ciiva.com/14277/tps79933-q1-14277826.pdf?src-supplier=Avnet; ComponentLink2Description: https://datasheet.ciiva.com/14277/tps79933-q1-14277826.pdf?src-supplier=Avnet; Item Type: IC
U27 = SGTL5000XNBA3: IC Audio Codec Stereo 32HVQFN; Manufacturer: NXP Semiconductors; Supplier: Arrow Electronics; Supplier Part Number: SGTL5000XNBA3; Manufacturer Part Number: SGTL5000XNBA3; RoHS: No; Category: CODECs; Stock: 327; Pricing: 1=7.3439, 10=6.7746, 25=6.3951, 50=6.0651, 100=5.8558, 500=5.7523 (USD); Item Type: *
X2 = AU-12.288MBE-T: XTAL OSC XO 12.2880MHZ CMOS SMD; Manufacturer: TXC; Supplier: Digi-Key; Supplier Part Number: 887-1638-1-ND; Manufacturer Part Number: AU-12.288MBE-T; RoHS: Yes; Category: Oscillators; Stock: 11857; Pricing: 1=2.17, 10=2.121, 50=2.02, 100=1.7675, 500=1.717, 1000=1.4645 (USD); ComponentLink1URL: https://datasheet.ciiva.com/6724/au-6724587.pdf?src-supplier=Digi-Key; ComponentLink1Description: https://datasheet.ciiva.com/6724/au-6724587.pdf?src-supplier=Digi-Key; ComponentLink2URL: https://datasheet.ciiva.com/6724/au-6724589.pdf?src-supplier=Digi-Key; ComponentLink2Description: https://datasheet.ciiva.com/6724/au-6724589.pdf?src-supplier=Digi-Key; ComponentLink3URL: https://datasheet.ciiva.com/6724/au-6724590.pdf?src-supplier=Digi-Key; ComponentLink3Description: https://datasheet.ciiva.com/6724/au-6724590.pdf?src-supplier=Digi-Key